# Altium schematic sheet DDR4_UDIMM CHANNEL-B0.schdoc
size 420 x 298 mm; Symbol: Sheet-Symbol_A3; Company: 嘉立创EDA; Version: V1.0; Page Size: A3; @Project Name: H610(2024/12/09); @Page Count: 36; @Update Date: 2025-10-09; @Create Date: 2025-10-09; @Schematic Name: SCHEMATIC1; @Page No: 7; @Page Name: DDR4_UDIMM CHANNEL-B0; Device: Sheet-Symbol_A3; @Board Name: SCHEMATIC1; @Create Time: 10:15:40; @Update Time: 10:18:17
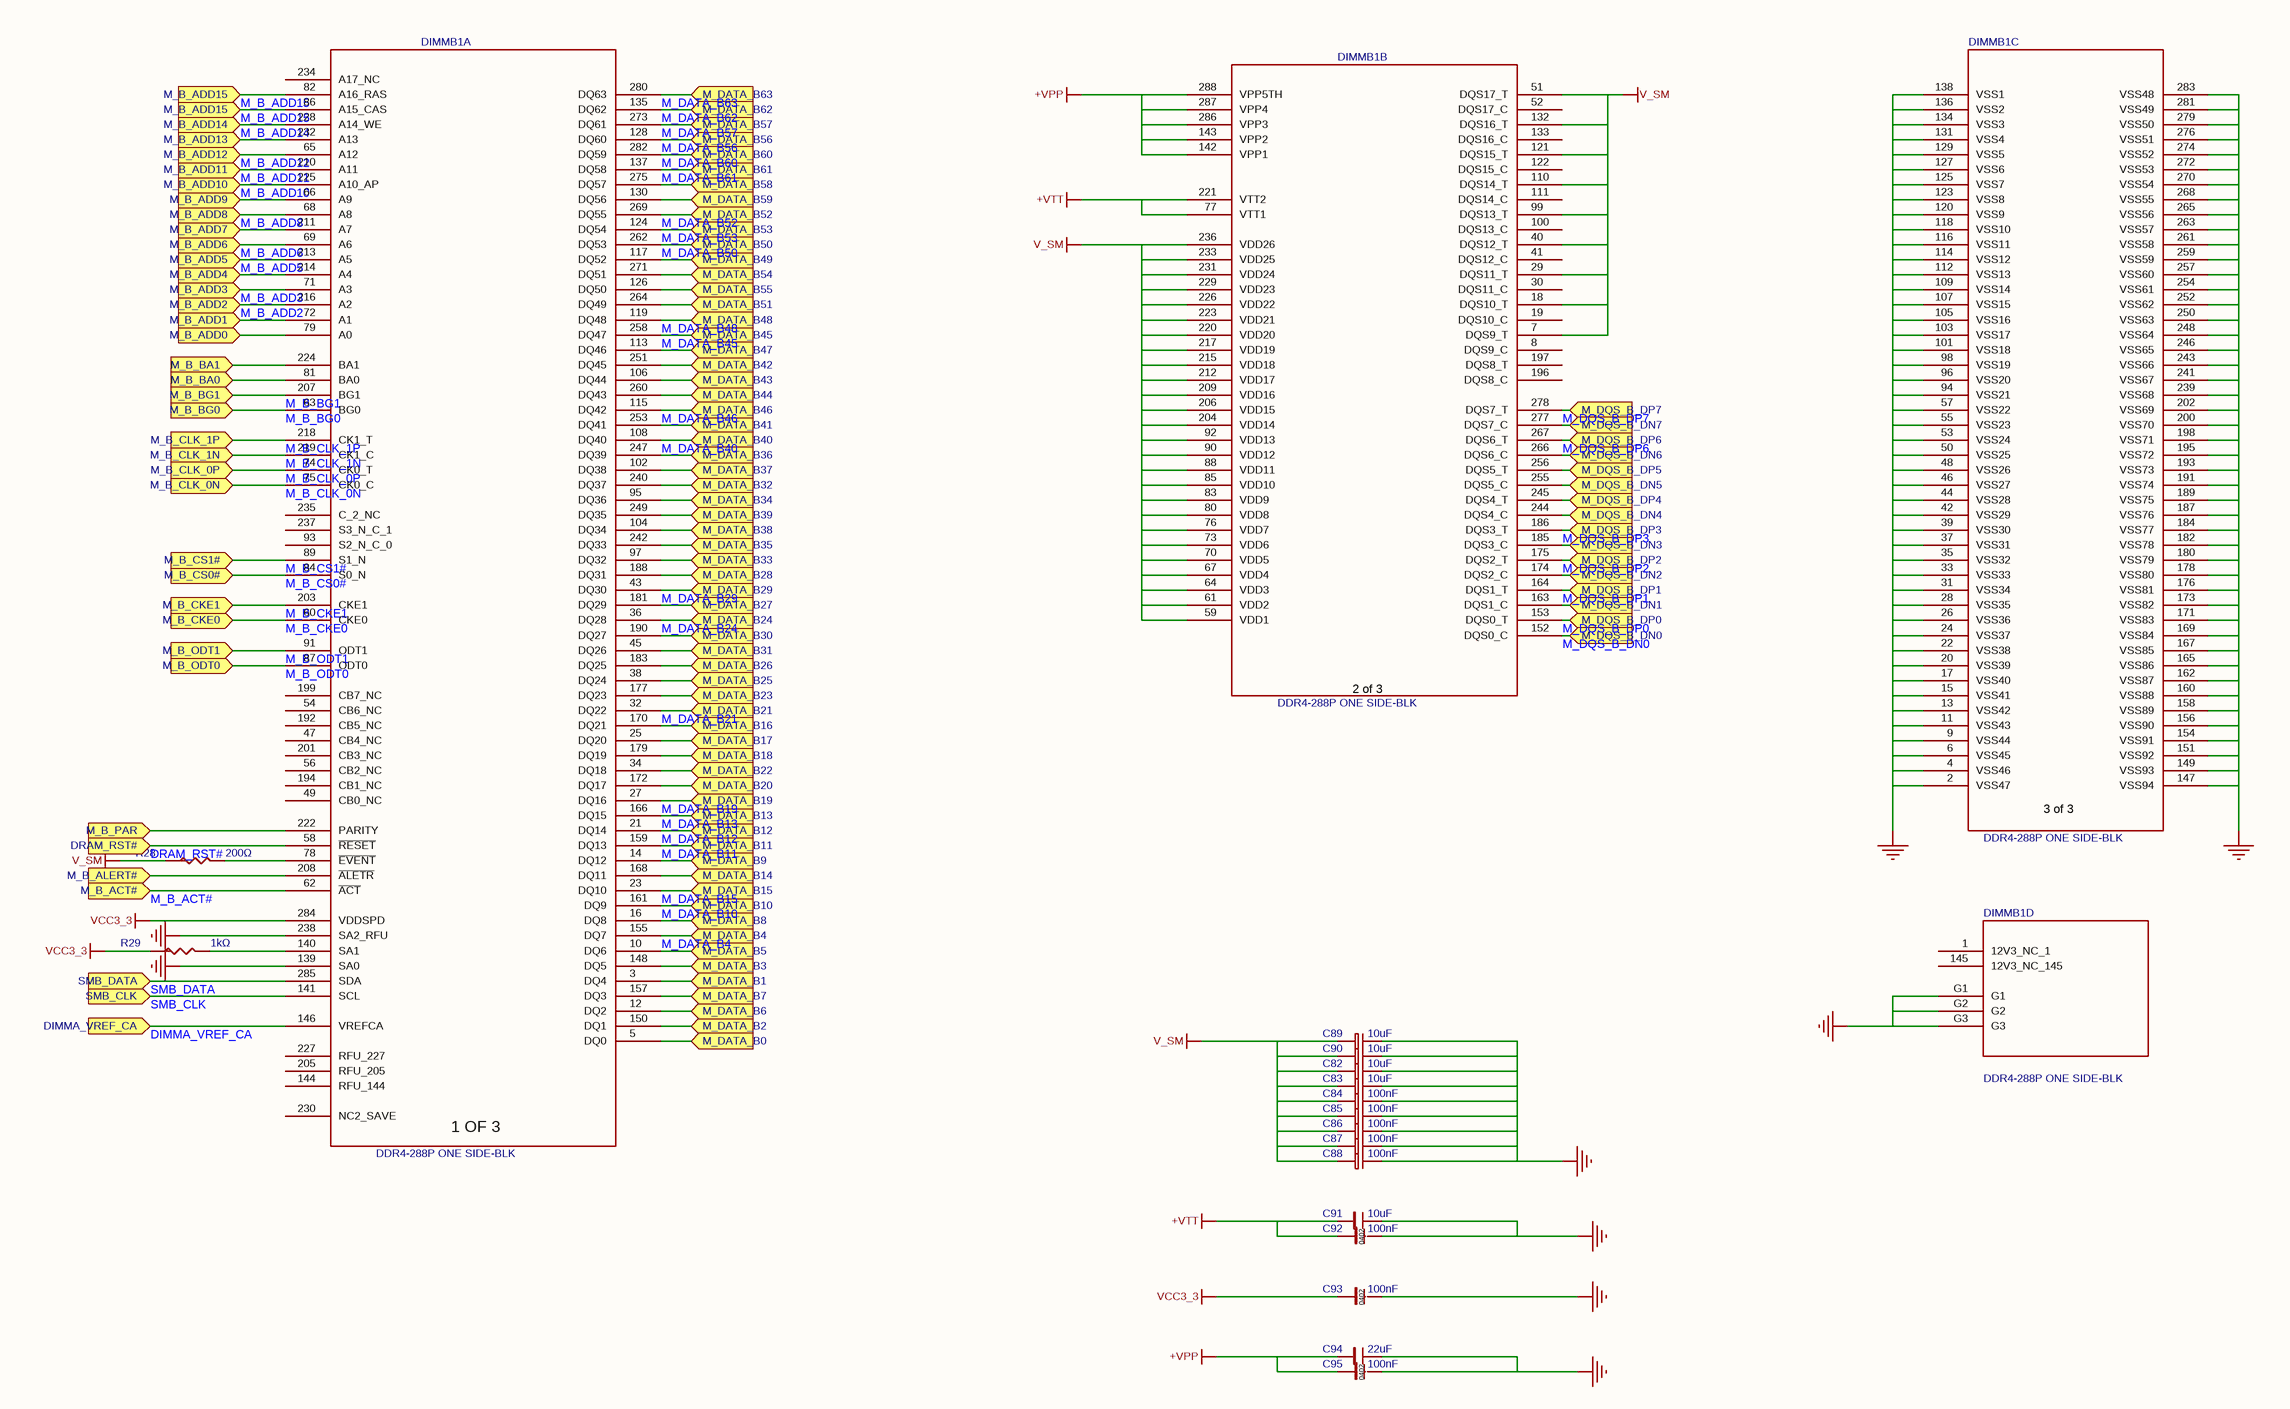
[diagram p0: DDR4_UDIMM CHANNEL-B0.schdoc]

## Parts
C82  10uF  [C0603_1]
C83  10uF  [C0603_1]
C84  100nF  [C0402_1]
C85  100nF  [C0402_3]
C86  100nF  [C0402_3]
C87  100nF  [C0402_1]
C88  100nF  [C0402_3]
C89  10uF  [C0603_2]
C90  10uF  [C0603_2]
C91  10uF  [C0603_1]
C92  100nF  [C0402_1]
C93  100nF  [C0402_3]
C94  22uF  [C0603_2]
C95  100nF  [C0402_1]
DIMMB1  value DDR4-288P ONE SIDE-BLK  [DDR4-288P-AKL_1]  (hidden comment: 90405-15112-2)  (parts A,B,C,D of 4)
R28  200Ω  [R0402_1]
R29  1kΩ  [R0402_3]

## Ports
DIMMA_VREF_CA (in), DRAM_RST# (in), M_B_ACT# (in), M_B_ADD0 (in), M_B_ADD1 (in), M_B_ADD2 (in), M_B_ADD3 (in), M_B_ADD4 (in), M_B_ADD5 (in), M_B_ADD6 (in), M_B_ADD7 (in), M_B_ADD8 (in), M_B_ADD9 (in), M_B_ADD10 (in), M_B_ADD11 (in), M_B_ADD12 (in), M_B_ADD13 (in), M_B_ADD14 (in), M_B_ADD15 (in), M_B_ALERT# (in), M_B_BA0 (in), M_B_BA1 (in), M_B_BG0 (in), M_B_BG1 (in), M_B_CKE0 (in), M_B_CKE1 (in), M_B_CLK_0N (in), M_B_CLK_0P (in), M_B_CLK_1N (in), M_B_CLK_1P (in), M_B_CS0# (in), M_B_CS1# (in), M_B_ODT0 (in), M_B_ODT1 (in), M_B_PAR (in), M_DATA_B0 (in), M_DATA_B1 (in), M_DATA_B2 (in), M_DATA_B3 (in), M_DATA_B4 (in), M_DATA_B5 (in), M_DATA_B6 (in), M_DATA_B7 (in), M_DATA_B8 (in), M_DATA_B9 (in), M_DATA_B10 (in), M_DATA_B11 (in), M_DATA_B12 (in), M_DATA_B13 (in), M_DATA_B14 (in), M_DATA_B15 (in), M_DATA_B16 (in), M_DATA_B17 (in), M_DATA_B18 (in), M_DATA_B19 (in), M_DATA_B20 (in), M_DATA_B21 (in), M_DATA_B22 (in), M_DATA_B23 (in), M_DATA_B24 (in), M_DATA_B25 (in), M_DATA_B26 (in), M_DATA_B27 (in), M_DATA_B28 (in), M_DATA_B29 (in), M_DATA_B30 (in), M_DATA_B31 (in), M_DATA_B32 (in), M_DATA_B33 (in), M_DATA_B34 (in), M_DATA_B35 (in), M_DATA_B36 (in), M_DATA_B37 (in), M_DATA_B38 (in), M_DATA_B39 (in), M_DATA_B40 (in), M_DATA_B41 (in), M_DATA_B42 (in), M_DATA_B43 (in), M_DATA_B44 (in), M_DATA_B45 (in), M_DATA_B46 (in), M_DATA_B47 (in), M_DATA_B48 (in), M_DATA_B49 (in), M_DATA_B50 (in), M_DATA_B51 (in), M_DATA_B52 (in), M_DATA_B53 (in), M_DATA_B54 (in), M_DATA_B55 (in), M_DATA_B56 (in), M_DATA_B57 (in), M_DATA_B58 (in), M_DATA_B59 (in), M_DATA_B60 (in), M_DATA_B61 (in), M_DATA_B62 (in), M_DATA_B63 (in), M_DQS_B_DN0 (in), M_DQS_B_DN1 (in), M_DQS_B_DN2 (in), M_DQS_B_DN3 (in), M_DQS_B_DN4 (in), M_DQS_B_DN5 (in), M_DQS_B_DN6 (in), M_DQS_B_DN7 (in), M_DQS_B_DP0 (in), M_DQS_B_DP1 (in), M_DQS_B_DP2 (in), M_DQS_B_DP3 (in), M_DQS_B_DP4 (in), M_DQS_B_DP5 (in), M_DQS_B_DP6 (in), M_DQS_B_DP7 (in), SMB_CLK (in), SMB_DATA (in)

## Nets
+VPP: C94.1 C95.1 DIMMB1.142(VPP1) DIMMB1.143(VPP2) DIMMB1.286(VPP3) DIMMB1.287(VPP4) DIMMB1.288(VPP5TH)
+VTT: C91.1 C92.1 DIMMB1.77(VTT1) DIMMB1.221(VTT2)
GND: C82.1 C83.1 C84.1 C85.1 C86.1 C87.1 C88.1 C89.1 C90.1 C91.2 C92.2 C93.2 C94.2 C95.2 DIMMB1.2(VSS47) DIMMB1.4(VSS46) DIMMB1.6(VSS45) DIMMB1.9(VSS44) DIMMB1.11(VSS43) DIMMB1.13(VSS42) DIMMB1.15(VSS41) DIMMB1.17(VSS40) DIMMB1.20(VSS39) DIMMB1.22(VSS38) DIMMB1.24(VSS37) DIMMB1.26(VSS36) DIMMB1.28(VSS35) DIMMB1.31(VSS34) DIMMB1.33(VSS33) DIMMB1.35(VSS32) DIMMB1.37(VSS31) DIMMB1.39(VSS30) DIMMB1.42(VSS29) DIMMB1.44(VSS28) DIMMB1.46(VSS27) DIMMB1.48(VSS26) DIMMB1.50(VSS25) DIMMB1.53(VSS24) DIMMB1.55(VSS23) DIMMB1.57(VSS22) DIMMB1.94(VSS21) DIMMB1.96(VSS20) DIMMB1.98(VSS19) DIMMB1.101(VSS18) DIMMB1.103(VSS17) DIMMB1.105(VSS16) DIMMB1.107(VSS15) DIMMB1.109(VSS14) DIMMB1.112(VSS13) DIMMB1.114(VSS12) DIMMB1.116(VSS11) DIMMB1.118(VSS10) DIMMB1.120(VSS9) DIMMB1.123(VSS8) DIMMB1.125(VSS7) DIMMB1.127(VSS6) DIMMB1.129(VSS5) DIMMB1.131(VSS4) DIMMB1.134(VSS3) DIMMB1.136(VSS2) DIMMB1.138(VSS1) DIMMB1.139(SA0) DIMMB1.147(VSS94) DIMMB1.149(VSS93) DIMMB1.151(VSS92) DIMMB1.154(VSS91) DIMMB1.156(VSS90) DIMMB1.158(VSS89) DIMMB1.160(VSS88) DIMMB1.162(VSS87) DIMMB1.165(VSS86) DIMMB1.167(VSS85) DIMMB1.169(VSS84) DIMMB1.171(VSS83) DIMMB1.173(VSS82) DIMMB1.176(VSS81) DIMMB1.178(VSS80) DIMMB1.180(VSS79) DIMMB1.182(VSS78) DIMMB1.184(VSS77) DIMMB1.187(VSS76) DIMMB1.189(VSS75) DIMMB1.191(VSS74) DIMMB1.193(VSS73) DIMMB1.195(VSS72) DIMMB1.198(VSS71) DIMMB1.200(VSS70) DIMMB1.202(VSS69) DIMMB1.238(SA2_RFU) DIMMB1.239(VSS68) DIMMB1.241(VSS67) DIMMB1.243(VSS66) DIMMB1.246(VSS65) DIMMB1.248(VSS64) DIMMB1.250(VSS63) DIMMB1.252(VSS62) DIMMB1.254(VSS61) DIMMB1.257(VSS60) DIMMB1.259(VSS59) DIMMB1.261(VSS58) DIMMB1.263(VSS57) DIMMB1.265(VSS56) DIMMB1.268(VSS55) DIMMB1.270(VSS54) DIMMB1.272(VSS53) DIMMB1.274(VSS52) DIMMB1.276(VSS51) DIMMB1.279(VSS50) DIMMB1.281(VSS49) DIMMB1.283(VSS48) DIMMB1.G1 DIMMB1.G2 DIMMB1.G3
V_SM: C82.2 C83.2 C84.2 C85.2 C86.2 C87.2 C88.2 C89.2 C90.2 DIMMB1.7(DQS9_T) DIMMB1.18(DQS10_T) DIMMB1.29(DQS11_T) DIMMB1.40(DQS12_T) DIMMB1.51(DQS17_T) DIMMB1.59(VDD1) DIMMB1.61(VDD2) DIMMB1.64(VDD3) DIMMB1.67(VDD4) DIMMB1.70(VDD5) DIMMB1.73(VDD6) DIMMB1.76(VDD7) DIMMB1.80(VDD8) DIMMB1.83(VDD9) DIMMB1.85(VDD10) DIMMB1.88(VDD11) DIMMB1.90(VDD12) DIMMB1.92(VDD13) DIMMB1.99(DQS13_T) DIMMB1.110(DQS14_T) DIMMB1.121(DQS15_T) DIMMB1.132(DQS16_T) DIMMB1.204(VDD14) DIMMB1.206(VDD15) DIMMB1.209(VDD16) DIMMB1.212(VDD17) DIMMB1.215(VDD18) DIMMB1.217(VDD19) DIMMB1.220(VDD20) DIMMB1.223(VDD21) DIMMB1.226(VDD22) DIMMB1.229(VDD23) DIMMB1.231(VDD24) DIMMB1.233(VDD25) DIMMB1.236(VDD26) R28.1
VCC3_3: C93.1 DIMMB1.284(VDDSPD) R29.1
DIMMA_VREF_CA: DIMMB1.146(VREFCA) ; port DIMMA_VREF_CA
DRAM_RST#: DIMMB1.58(~{RESET}) ; port DRAM_RST#
M_B_ACT#: DIMMB1.62(~{ACT}) ; port M_B_ACT#
M_B_ADD0: DIMMB1.79(A0) ; port M_B_ADD0
M_B_ADD1: DIMMB1.72(A1) ; port M_B_ADD1
M_B_ADD2: DIMMB1.216(A2) ; port M_B_ADD2
M_B_ADD3: DIMMB1.71(A3) ; port M_B_ADD3
M_B_ADD4: DIMMB1.214(A4) ; port M_B_ADD4
M_B_ADD5: DIMMB1.213(A5) ; port M_B_ADD5
M_B_ADD6: DIMMB1.69(A6) ; port M_B_ADD6
M_B_ADD7: DIMMB1.211(A7) ; port M_B_ADD7
M_B_ADD8: DIMMB1.68(A8) ; port M_B_ADD8
M_B_ADD9: DIMMB1.66(A9) ; port M_B_ADD9
M_B_ADD10: DIMMB1.225(A10_AP) ; port M_B_ADD10
M_B_ADD11: DIMMB1.210(A11) ; port M_B_ADD11
M_B_ADD12: DIMMB1.65(A12) ; port M_B_ADD12
M_B_ADD13: DIMMB1.232(A13) ; port M_B_ADD13
M_B_ADD14: DIMMB1.228(A14_WE) ; port M_B_ADD14
M_B_ADD15: DIMMB1.82(A16_RAS) DIMMB1.86(A15_CAS) ; port M_B_ADD15
M_B_ALERT#: DIMMB1.208(~{ALETR}) ; port M_B_ALERT#
M_B_BA0: DIMMB1.81(BA0) ; port M_B_BA0
M_B_BA1: DIMMB1.224(BA1) ; port M_B_BA1
M_B_BG0: DIMMB1.63(BG0) ; port M_B_BG0
M_B_BG1: DIMMB1.207(BG1) ; port M_B_BG1
M_B_CKE0: DIMMB1.60(CKE0) ; port M_B_CKE0
M_B_CKE1: DIMMB1.203(CKE1) ; port M_B_CKE1
M_B_CLK_0N: DIMMB1.75(CK0_C) ; port M_B_CLK_0N
M_B_CLK_0P: DIMMB1.74(CK0_T) ; port M_B_CLK_0P
M_B_CLK_1N: DIMMB1.219(CK1_C) ; port M_B_CLK_1N
M_B_CLK_1P: DIMMB1.218(CK1_T) ; port M_B_CLK_1P
M_B_CS0#: DIMMB1.84(S0_N) ; port M_B_CS0#
M_B_CS1#: DIMMB1.89(S1_N) ; port M_B_CS1#
M_B_ODT0: DIMMB1.87(ODT0) ; port M_B_ODT0
M_B_ODT1: DIMMB1.91(ODT1) ; port M_B_ODT1
M_B_PAR: DIMMB1.222(PARITY) ; port M_B_PAR
M_DATA_B0: DIMMB1.5(DQ0) ; port M_DATA_B0
M_DATA_B1: DIMMB1.3(DQ4) ; port M_DATA_B1
M_DATA_B2: DIMMB1.150(DQ1) ; port M_DATA_B2
M_DATA_B3: DIMMB1.148(DQ5) ; port M_DATA_B3
M_DATA_B4: DIMMB1.155(DQ7) ; port M_DATA_B4
M_DATA_B5: DIMMB1.10(DQ6) ; port M_DATA_B5
M_DATA_B6: DIMMB1.12(DQ2) ; port M_DATA_B6
M_DATA_B7: DIMMB1.157(DQ3) ; port M_DATA_B7
M_DATA_B8: DIMMB1.16(DQ8) ; port M_DATA_B8
M_DATA_B9: DIMMB1.14(DQ12) ; port M_DATA_B9
M_DATA_B10: DIMMB1.161(DQ9) ; port M_DATA_B10
M_DATA_B11: DIMMB1.159(DQ13) ; port M_DATA_B11
M_DATA_B12: DIMMB1.21(DQ14) ; port M_DATA_B12
M_DATA_B13: DIMMB1.166(DQ15) ; port M_DATA_B13
M_DATA_B14: DIMMB1.168(DQ11) ; port M_DATA_B14
M_DATA_B15: DIMMB1.23(DQ10) ; port M_DATA_B15
M_DATA_B16: DIMMB1.170(DQ21) ; port M_DATA_B16
M_DATA_B17: DIMMB1.25(DQ20) ; port M_DATA_B17
M_DATA_B18: DIMMB1.179(DQ19) ; port M_DATA_B18
M_DATA_B19: DIMMB1.27(DQ16) ; port M_DATA_B19
M_DATA_B20: DIMMB1.172(DQ17) ; port M_DATA_B20
M_DATA_B21: DIMMB1.32(DQ22) ; port M_DATA_B21
M_DATA_B22: DIMMB1.34(DQ18) ; port M_DATA_B22
M_DATA_B23: DIMMB1.177(DQ23) ; port M_DATA_B23
M_DATA_B24: DIMMB1.36(DQ28) ; port M_DATA_B24
M_DATA_B25: DIMMB1.38(DQ24) ; port M_DATA_B25
M_DATA_B26: DIMMB1.183(DQ25) ; port M_DATA_B26
M_DATA_B27: DIMMB1.181(DQ29) ; port M_DATA_B27
M_DATA_B28: DIMMB1.188(DQ31) ; port M_DATA_B28
M_DATA_B29: DIMMB1.43(DQ30) ; port M_DATA_B29
M_DATA_B30: DIMMB1.190(DQ27) ; port M_DATA_B30
M_DATA_B31: DIMMB1.45(DQ26) ; port M_DATA_B31
M_DATA_B32: DIMMB1.240(DQ37) ; port M_DATA_B32
M_DATA_B33: DIMMB1.97(DQ32) ; port M_DATA_B33
M_DATA_B34: DIMMB1.95(DQ36) ; port M_DATA_B34
M_DATA_B35: DIMMB1.242(DQ33) ; port M_DATA_B35
M_DATA_B36: DIMMB1.247(DQ39) ; port M_DATA_B36
M_DATA_B37: DIMMB1.102(DQ38) ; port M_DATA_B37
M_DATA_B38: DIMMB1.104(DQ34) ; port M_DATA_B38
M_DATA_B39: DIMMB1.249(DQ35) ; port M_DATA_B39
M_DATA_B40: DIMMB1.108(DQ40) ; port M_DATA_B40
M_DATA_B41: DIMMB1.253(DQ41) ; port M_DATA_B41
M_DATA_B42: DIMMB1.251(DQ45) ; port M_DATA_B42
M_DATA_B43: DIMMB1.106(DQ44) ; port M_DATA_B43
M_DATA_B44: DIMMB1.260(DQ43) ; port M_DATA_B44
M_DATA_B45: DIMMB1.258(DQ47) ; port M_DATA_B45
M_DATA_B46: DIMMB1.115(DQ42) ; port M_DATA_B46
M_DATA_B47: DIMMB1.113(DQ46) ; port M_DATA_B47
M_DATA_B48: DIMMB1.119(DQ48) ; port M_DATA_B48
M_DATA_B49: DIMMB1.117(DQ52) ; port M_DATA_B49
M_DATA_B50: DIMMB1.262(DQ53) ; port M_DATA_B50
M_DATA_B51: DIMMB1.264(DQ49) ; port M_DATA_B51
M_DATA_B52: DIMMB1.269(DQ55) ; port M_DATA_B52
M_DATA_B53: DIMMB1.124(DQ54) ; port M_DATA_B53
M_DATA_B54: DIMMB1.271(DQ51) ; port M_DATA_B54
M_DATA_B55: DIMMB1.126(DQ50) ; port M_DATA_B55
M_DATA_B56: DIMMB1.128(DQ60) ; port M_DATA_B56
M_DATA_B57: DIMMB1.273(DQ61) ; port M_DATA_B57
M_DATA_B58: DIMMB1.275(DQ57) ; port M_DATA_B58
M_DATA_B59: DIMMB1.130(DQ56) ; port M_DATA_B59
M_DATA_B60: DIMMB1.282(DQ59) ; port M_DATA_B60
M_DATA_B61: DIMMB1.137(DQ58) ; port M_DATA_B61
M_DATA_B62: DIMMB1.135(DQ62) ; port M_DATA_B62
M_DATA_B63: DIMMB1.280(DQ63) ; port M_DATA_B63
M_DQS_B_DN0: DIMMB1.152(DQS0_C) ; port M_DQS_B_DN0
M_DQS_B_DN1: DIMMB1.163(DQS1_C) ; port M_DQS_B_DN1
M_DQS_B_DN2: DIMMB1.174(DQS2_C) ; port M_DQS_B_DN2
M_DQS_B_DN3: DIMMB1.185(DQS3_C) ; port M_DQS_B_DN3
M_DQS_B_DN4: DIMMB1.244(DQS4_C) ; port M_DQS_B_DN4
M_DQS_B_DN5: DIMMB1.255(DQS5_C) ; port M_DQS_B_DN5
M_DQS_B_DN6: DIMMB1.266(DQS6_C) ; port M_DQS_B_DN6
M_DQS_B_DN7: DIMMB1.277(DQS7_C) ; port M_DQS_B_DN7
M_DQS_B_DP0: DIMMB1.153(DQS0_T) ; port M_DQS_B_DP0
M_DQS_B_DP1: DIMMB1.164(DQS1_T) ; port M_DQS_B_DP1
M_DQS_B_DP2: DIMMB1.175(DQS2_T) ; port M_DQS_B_DP2
M_DQS_B_DP3: DIMMB1.186(DQS3_T) ; port M_DQS_B_DP3
M_DQS_B_DP4: DIMMB1.245(DQS4_T) ; port M_DQS_B_DP4
M_DQS_B_DP5: DIMMB1.256(DQS5_T) ; port M_DQS_B_DP5
M_DQS_B_DP6: DIMMB1.267(DQS6_T) ; port M_DQS_B_DP6
M_DQS_B_DP7: DIMMB1.278(DQS7_T) ; port M_DQS_B_DP7
SMB_CLK: DIMMB1.141(SCL) ; port SMB_CLK
SMB_DATA: DIMMB1.285(SDA) ; port SMB_DATA
NetDIMMB1_78: DIMMB1.78(~{EVENT}) R28.2
NetDIMMB1_140: DIMMB1.140(SA1) R29.2

Not connected (* = marked no-connect by the designer): DIMMB1 1(12V3_NC_1) 8(DQS9_C) 19(DQS10_C) 30(DQS11_C) 41(DQS12_C) 47(CB4_NC) 49(CB0_NC) 52(DQS17_C) 54(CB6_NC) 56(CB2_NC) 93(S2_N_C_0) 100(DQS13_C) 111(DQS14_C) 122(DQS15_C) 133(DQS16_C) 144(RFU_144) 145(12V3_NC_145) 192(CB5_NC) 194(CB1_NC) 196(DQS8_C) 197(DQS8_T) 199(CB7_NC) 201(CB3_NC) 205(RFU_205) 227(RFU_227) 230(NC2_SAVE) 234(A17_NC) 235(C_2_NC) 237(S3_N_C_1)

## Notes on the sheet
- 更新日期
- 2025-10-09
- 原理图
- 图页
- SCHEMATIC1
- DDR4_UDIMM CHANNEL-B0
- 创建日期
- 物料编码
- 审阅
- 绘制
- H610(2024/12/09)
- 版本
- V1.0
- 尺寸
- A3
- 页
- 7
- 嘉立创EDA
- 共
- 36
- (in symbol 90405-15112-2, part A) 1 OF 3
- (in symbol 90405-15112-2, part B) 2 of 3
- (in symbol 90405-15112-2, part C) 3 of 3

## Library data of the parts
C82 C83 C89 C90 = CL05A106MQ5NUNC: 容值:10uF;精度:±20%;额定电压:6.3V;材质(温度系数):X5R;; Manufacturer: SAMSUNG(三星); Symbol: CAP NP_23; ModelId: 36a51122f27c49738f86b3bfa98863e0; Tolerance: ±20%; AddInBom: yes; Voltage Rated: 6.3V; ModelName: C0402_L1.0-W0.5-H0.5; ModelTransform: 39.37,19.685,0,0,0,0,0,0,0; Temperature Coefficient: X5R; Device: CL05A106MQ5NUNC; Value: 10uF; Supplier: LCSC; Datasheet: https://atta.szlcsc.com/upload/public/pdf/source/20220823/2B02EE04F8F211D38A52DCB16EB6BEBA.pdf; SupplierPart: C15525; ConvertToPcb: yes; LCSC Part Name: 10uF ±20% 6.3V; JLCPCB Part Class: Basic Part; ManufacturerPart: CL05A106MQ5NUNC; Supplier Footprint: 0402
  C82 C83: FootprintName: C0603_1
  C89 C90: FootprintName: C0603_2
C84-C88 = CL05B104KO5NNNC: 容值:100nF;精度:±10%;额定电压:16V;材质(温度系数):X7R;; Manufacturer: SAMSUNG(三星); Symbol: CAP NP_23; ModelId: 36a51122f27c49738f86b3bfa98863e0; Tolerance: ±10%; AddInBom: yes; Voltage Rated: 16V; ModelName: C0402_L1.0-W0.5-H0.5; ModelTransform: 39.37,19.685,0,0,0,0,0,0,0; Temperature Coefficient: X7R; Device: CL05B104KO5NNNC; Value: 100nF; Supplier: LCSC; Datasheet: https://atta.szlcsc.com/upload/public/pdf/source/20160103/1457707674891.pdf; SupplierPart: C1525; ConvertToPcb: yes; LCSC Part Name: 100nF ±10% 16V; JLCPCB Part Class: Basic Part; ManufacturerPart: CL05B104KO5NNNC; Supplier Footprint: 0402
  C84 C87: FootprintName: C0402_1
  C85 C86 C88: FootprintName: C0402_3
C91 = CL10A106KP8NNNC: 容值:10uF;精度:±10%;额定电压:10V;材质(温度系数):X5R;; Manufacturer: SAMSUNG(三星); Symbol: C0805; ModelId: ac125912035d415993ca9572d50418b1; Tolerance: ±10%; AddInBom: yes; Voltage Rated: 10V; ModelName: C0603_L1.6-W0.8-H0.8; ModelTransform: 62.992,31.496,0,0,0,0,0,0,0; Temperature Coefficient: X5R; Device: CL10A106KP8NNNC; Value: 10uF; Supplier: LCSC; Datasheet: https://atta.szlcsc.com/upload/public/pdf/source/20160103/1457707703378.pdf; FootprintName: C0603_1; SupplierPart: C19702; ConvertToPcb: yes; LCSC Part Name: 10uF ±10% 10V; JLCPCB Part Class: Basic Part; ManufacturerPart: CL10A106KP8NNNC; Supplier Footprint: 0603
C92 C93 C95 = CL05B104KO5NNNC: 容值:100nF;精度:±10%;额定电压:16V;材质(温度系数):X7R;; Manufacturer: SAMSUNG(三星); Symbol: C0402; ModelId: 36a51122f27c49738f86b3bfa98863e0; Tolerance: ±10%; AddInBom: yes; Voltage Rated: 16V; ModelName: C0402_L1.0-W0.5-H0.5; ModelTransform: 39.37,19.685,0,0,0,0,0,0,0; Temperature Coefficient: X7R; Device: CL05B104KO5NNNC; Value: 100nF; Supplier: LCSC; Datasheet: https://atta.szlcsc.com/upload/public/pdf/source/20160103/1457707674891.pdf; SupplierPart: C1525; ConvertToPcb: yes; LCSC Part Name: 100nF ±10% 16V; JLCPCB Part Class: Basic Part; ManufacturerPart: CL05B104KO5NNNC; Supplier Footprint: 0402
  C92 C95: FootprintName: C0402_1
  C93: FootprintName: C0402_3
C94 = CL10A226MQ8NRNC: 容值:22uF;精度:±20%;额定电压:6.3V;材质(温度系数):X5R;; Manufacturer: SAMSUNG(三星); Symbol: C0805; AddInBom: yes; Tolerance: ±20%; Voltage Rated: 6.3V; Temperature Coefficient: X5R; ModelId: ac125912035d415993ca9572d50418b1; ModelName: C0603_L1.6-W0.8-H0.8; ModelTransform: 62.992,31.496,0,0,0,0,0,0,0; Device: CL10A226MQ8NRNC; Value: 22uF; LCSC Part Name: 22uF ±20% 6.3V; SupplierPart: C59461; ManufacturerPart: CL10A226MQ8NRNC; Supplier Footprint: 0603; JLCPCB Part Class: Basic Part; Datasheet: https://atta.szlcsc.com/upload/public/pdf/source/20160218/1457707763339.pdf; Supplier: LCSC; ConvertToPcb: yes; FootprintName: C0603_2
DIMMB1 = 90405-15112-2: 连接器类型:DDR4;间距:0.85mm;引脚总数:288P;安装方式:直插;工作温度范围:-55℃~+105℃;; Manufacturer: UMaxconn(友贸); Symbol: DDR4_0; AddInBom: yes; ModelId: 99c36b498e914ce59dfe50adf1b55e89; ModelName: CONN-TH_288P-90405; ModelTransform: 5799.201,244.488,0,0,0,0,0,0,-157.48; Connector Type: DDR4; Pitch: 0.85mm; Device: 90405-15112-2; LCSC Part Name: 0.85mm P数:288P; SupplierPart: C2922446; ManufacturerPart: 90405-15112-2; Supplier Footprint: 插件,P=0.85mm; JLCPCB Part Class: Extended Part; Datasheet: https://atta.szlcsc.com/upload/public/pdf/source/20211119/8F83E07E75D2FB3E34252D81E838E37C.pdf; Supplier: LCSC; ConvertToPcb: yes; FootprintName: DDR4-288P-AKL_1; Number of Pins: 288P; Mounting Style: 直插; Height Above Board: 21mm; Contact Material: 铜合金; Contact Plating: 金; Operating Temperature Range: -55℃~+105℃
R28 = 0402WGF2000TCE: 电阻类型:厚膜电阻;阻值:200Ω;精度:±1%;功率:62.5mW;; Manufacturer: UNI-ROYAL(厚声); Symbol: 42A**-F; PCB Footprint: R0402; ModelId: 671aefced39d4c318694bba8bd8efd39; Tolerance: ±1%; AddInBom: yes; Power(Watts): 62.5mW; ModelName: R0402_L1.0-W0.5-H0.5; ModelTransform: 39.37,19.685,0,0,0,0,0,0.0005,0; Overload Voltage (Max): 50V; Temperature Coefficient: ±100ppm/℃; Device: 0402WGF2000TCE; Value: 200Ω; Type: 厚膜电阻; Supplier: LCSC; Datasheet: https://atta.szlcsc.com/upload/public/pdf/source/20200306/C422600_1E6D84923E4A46A82E41ADD87F860B5C.pdf; FootprintName: R0402_1; SupplierPart: C25087; ConvertToPcb: yes; LCSC Part Name: 200Ω ±1% 62.5mW; JLCPCB Part Class: Basic Part; ManufacturerPart: 0402WGF2000TCE; Supplier Footprint: 0402; Operating Temperature Range: -55℃~+155℃
R29 = 0402WGF1001TCE: 电阻类型:厚膜电阻;阻值:1kΩ;精度:±1%;功率:62.5mW;; Manufacturer: UNI-ROYAL(厚声); Symbol: 42A**-F; PCB Footprint: R0402; ModelId: 671aefced39d4c318694bba8bd8efd39; Tolerance: ±1%; AddInBom: yes; Power(Watts): 62.5mW; ModelName: R0402_L1.0-W0.5-H0.5; ModelTransform: 39.37,19.685,0,0,0,0,0,0.0005,0; Overload Voltage (Max): 50V; Temperature Coefficient: ±100ppm/℃; Device: 0402WGF1001TCE; Value: 1kΩ; Type: 厚膜电阻; Supplier: LCSC; Datasheet: https://atta.szlcsc.com/upload/public/pdf/source/20200306/C422600_1E6D84923E4A46A82E41ADD87F860B5C.pdf; FootprintName: R0402_3; SupplierPart: C11702; ConvertToPcb: yes; LCSC Part Name: 1kΩ ±1% 62.5mW; JLCPCB Part Class: Basic Part; ManufacturerPart: 0402WGF1001TCE; Supplier Footprint: 0402; Operating Temperature Range: -55℃~+155℃